# Altium schematic sheet POWER_CELL_PROTECTION_AND_CHARGING.SchDoc
size A4; SheetNumber: 3; SheetTotal: 5
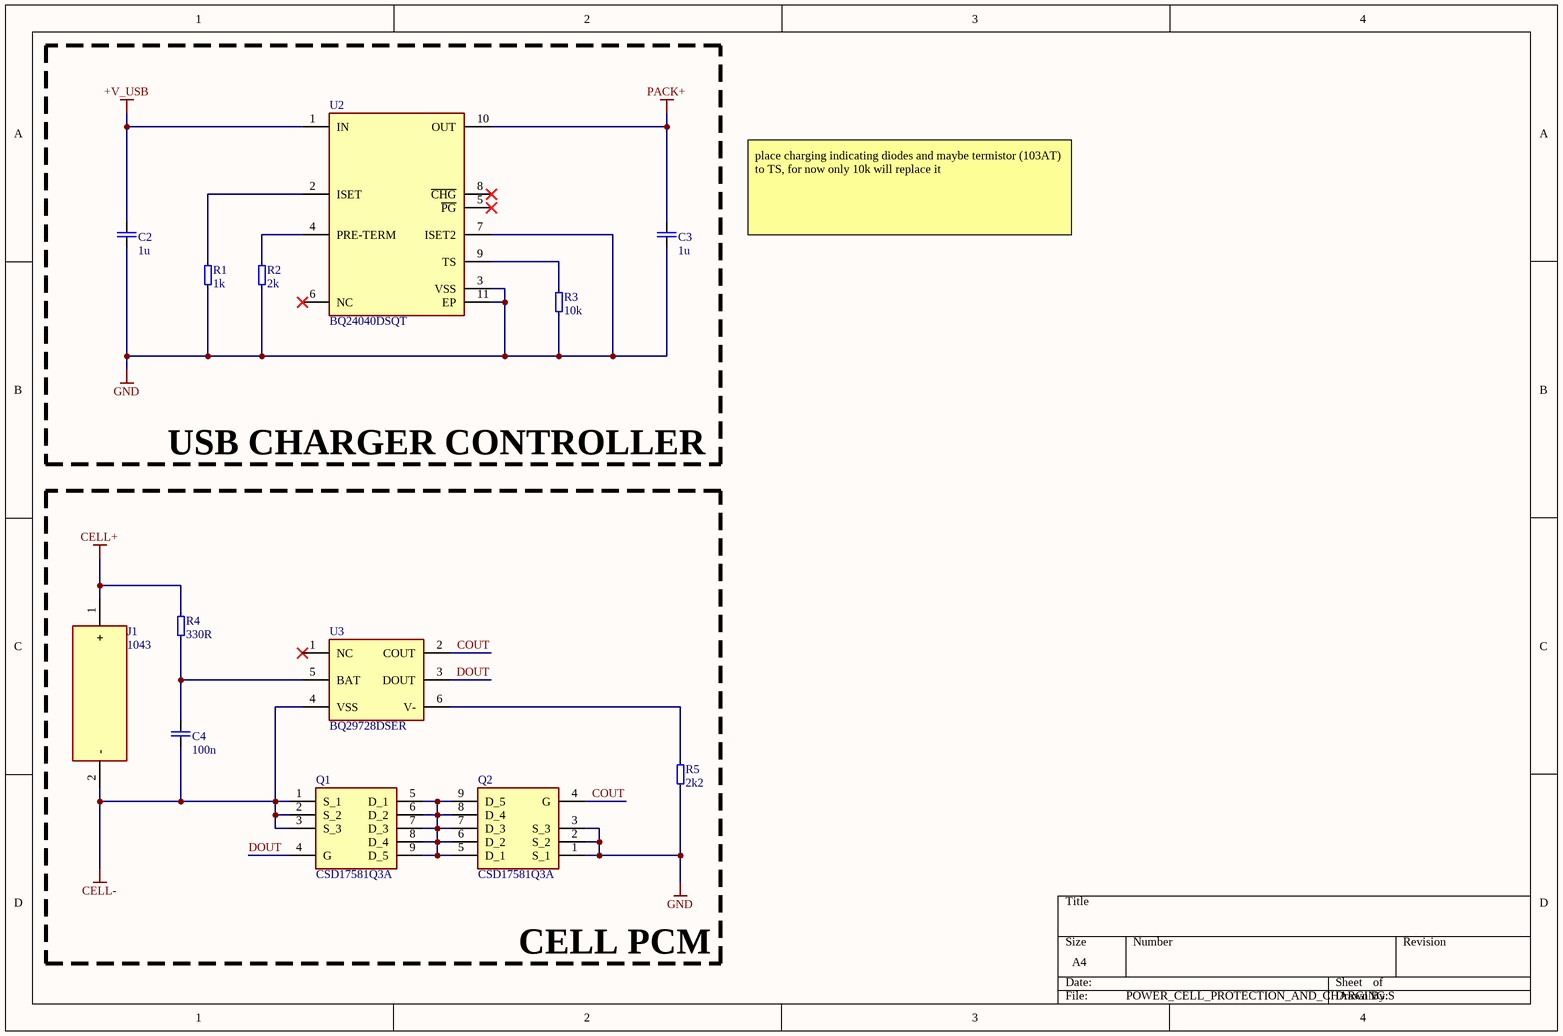
[diagram p0: POWER_CELL_PROTECTION_AND_CHARGING.SchDoc]

## Parts
C2  1u  [C0603]
C3  1u  [C0603]
C4  100n  [C0402]
J1  1043  [1043_KEY]
Q1  CSD17581Q3A  [CSD17581Q3A]
Q2  CSD17581Q3A  [CSD17581Q3A]
R1  1k  [R0402]
R2  2k  [R0402]
R3  10k  [R0402]
R4  330R  [R0402]
R5  2k2  [R0402]
U2  BQ24040DSQT  [SON40P200X200X80-11N]
U3  BQ29728DSER  [TPS610985DSET]

## Blocks framed on the sheet
USB CHARGER CONTROLLER: C2 C3 R1-R3 U2
CELL PCM: C4 J1 Q1 Q2 R4 R5 U3

## Nets
+V_USB: C2.2 U2.1(IN)
CELL+: J1.1(+) R4.2
CELL-: C4.1 J1.2(-) Q1.1(S_1) Q1.2(S_2) Q1.3(S_3) U3.4(VSS)
GND: C2.1 C3.1 Q2.1(S_1) Q2.2(S_2) Q2.3(S_3) R1.1 R2.1 R3.1 R5.1 U2.3(VSS) U2.7(ISET2) U2.11(EP)
PACK+: C3.2 U2.10(OUT)
COUT: Q2.4(G) U3.2(COUT)
DOUT: Q1.4(G) U3.3(DOUT)
NetC4_2: C4.2 R4.1 U3.5(BAT)
NetQ1_5: Q1.5(D_1) Q1.6(D_2) Q1.7(D_3) Q1.8(D_4) Q1.9(D_5) Q2.5(D_1) Q2.6(D_2) Q2.7(D_3) Q2.8(D_4) Q2.9(D_5)
NetR1_2: R1.2 U2.2(ISET)
NetR2_2: R2.2 U2.4(PRE-TERM)
NetR3_2: R3.2 U2.9(TS)
NetR5_2: R5.2 U3.6(V-)

Not connected (* = marked no-connect by the designer): U2 5(~{PG})* 6(NC)* 8(~{CHG})*; U3 1(NC)*

## Notes on the sheet
- place charging indicating diodes and maybe termistor (103AT) to TS, for now only 10k will replace it

## Library data of the parts
C2 C3 = CMP-00024-8: Generic 0603 SMD Ceramic Capacitor
C4 = CMP-00023-15: Generic SMD 0402 Ceramic Capacitor
J1 = 1043: Description; Manufacturer_Name: Keystone Electronics; Copyright: Copyright (C) 2026 Ultra Librarian. All rights reserved.; Manufacturer_Part_Number: 1043; RefDes: RefDes; Type: Type
Q1 Q2 = CSD17581Q3A: 30-V, N channel NexFET power MOSFET, single SON 3 mm x 3 mm, 4.7 mOhm; Manufacturer_Name: Texas Instruments; Geometry.Height: 0.9mm; Mouser Part Number: 595-CSD17581Q3A; Mouser Price/Stock: https://www.mouser.co.uk/ProductDetail/Texas-Instruments/CSD17581Q3A?qs=%2FP2Ij7fVdhEBu0ceoVBClg%3D%3D; Manufacturer_Part_Number: CSD17581Q3A; Datasheet Link: https://www.ti.com/product/CSD17581Q3A?utm_source=google&utm_medium=cpc&utm_campaign=app-null-null-GPN_EN-cpc-pf-google-soas_en_cons&utm_content=CSD17581Q3A&ds_k=CSD17581Q3A&DCM=yes&gclsrc=aw.ds&gad_source=1&gad_campaignid=8753799319&gbraid=0AAAAAC068F0J1
R1-R5 = CMP-00016-11: Generic 0402 SMD Resistor
U2 = BQ24040DSQT: 1A 1-Cell Li-Ion Battery Charger WSON10 Texas Instruments BQ24040DSQT, Battery Charge Controller, 1000mA, 10-Pin SON; Geometry.Height: 0.8mm; Mouser Part Number: 595-BQ24040DSQT; Mouser Price/Stock: https://www.mouser.co.uk/ProductDetail/Texas-Instruments/BQ24040DSQT?qs=c7TMWs5treRrgyn%2F898iNQ%3D%3D; Manufacturer_Name: Texas Instruments; Manufacturer_Part_Number: BQ24040DSQT; Datasheet Link: http://www.ti.com/lit/ds/symlink/bq24040.pdf
U3 = BQ29728DSER: PCM IC; Manufacturer_Name: Texas Instruments; Manufacturer_Part_Number: BQ29707DSET; Datasheet Link: http://www.ti.com/lit/ds/symlink/bq2970.pdf; Height: 0.8mm; Mouser Part Number: 595-BQ29707DSET; Mouser Price/Stock: https://www.mouser.co.uk/ProductDetail/Texas-Instruments/BQ29707DSET?qs=7z%252BmIopC6%2FK8PFHAGER5Bg%3D%3D; Arrow Part Number: BQ29707DSET; Arrow Price/Stock: https://www.arrow.com/en/products/bq29707dset/texas-instruments.html?utm_currency=USD&region=nac